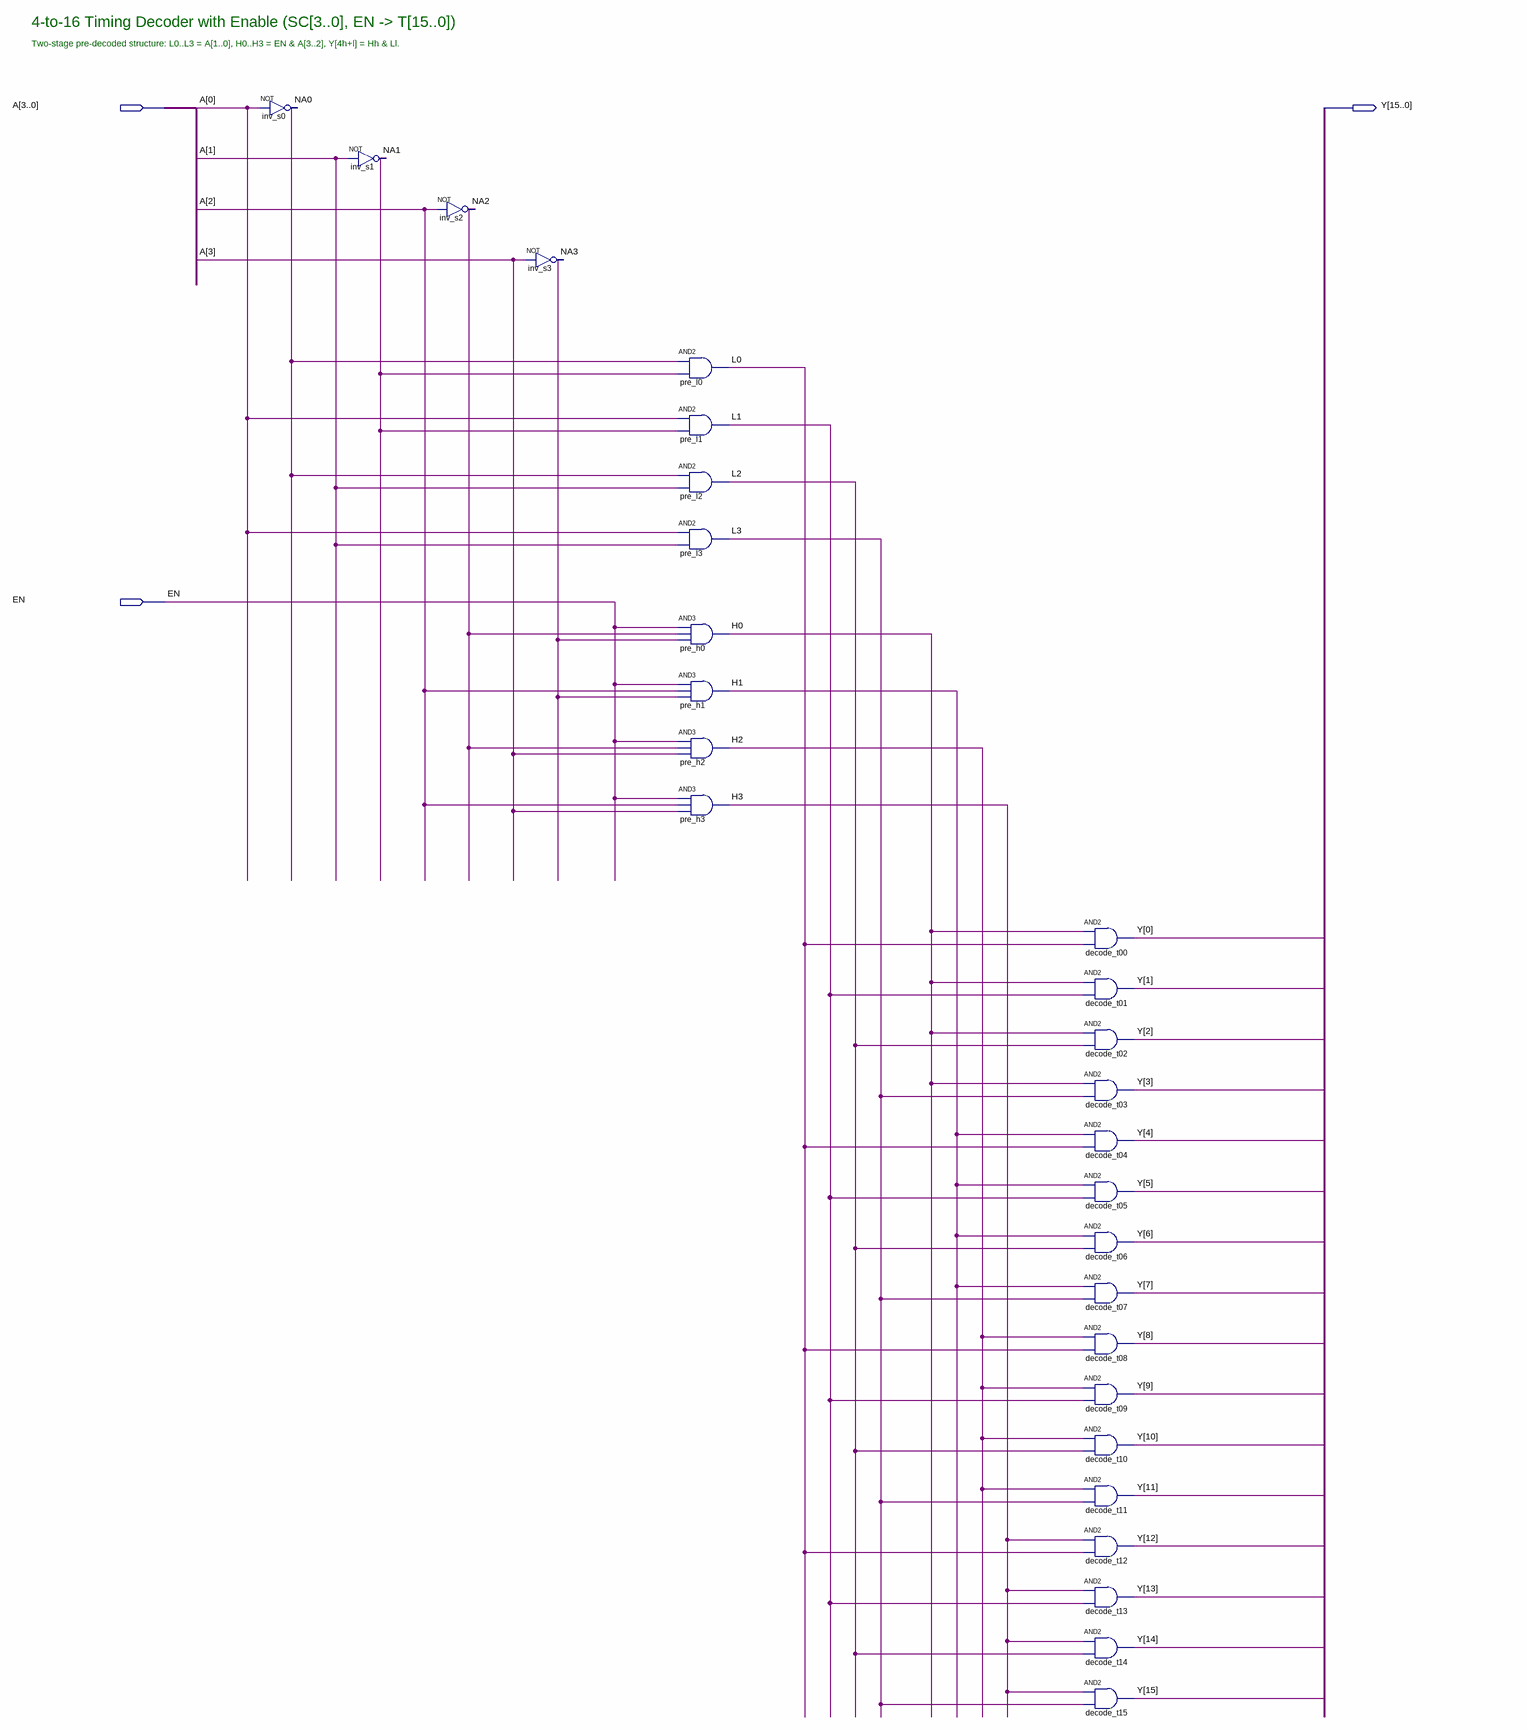
[diagram p0: schematic sheet]
// Quartus schematic dec416_en.bdf as structural Verilog: 28 symbols, 3 pins
module dec416_en (
  input  [3:0] A,
  input  EN,
  output [15:0] Y
);

  wire H0, H1, H2, H3, L0, L1, L2, L3, NA0, NA1, NA2, NA3;

  not inv_s0 (NA0, A[0]);
  not inv_s1 (NA1, A[1]);
  not inv_s2 (NA2, A[2]);
  not inv_s3 (NA3, A[3]);
  and pre_l0 (L0, NA0, NA1);
  and pre_l1 (L1, A[0], NA1);
  and pre_l2 (L2, NA0, A[1]);
  and pre_l3 (L3, A[0], A[1]);
  and pre_h0 (H0, EN, NA2, NA3);
  and pre_h1 (H1, EN, A[2], NA3);
  and pre_h2 (H2, EN, NA2, A[3]);
  and pre_h3 (H3, EN, A[2], A[3]);
  and decode_t00 (Y[0], H0, L0);
  and decode_t01 (Y[1], H0, L1);
  and decode_t02 (Y[2], H0, L2);
  and decode_t03 (Y[3], H0, L3);
  and decode_t04 (Y[4], H1, L0);
  and decode_t05 (Y[5], H1, L1);
  and decode_t06 (Y[6], H1, L2);
  and decode_t07 (Y[7], H1, L3);
  and decode_t08 (Y[8], H2, L0);
  and decode_t09 (Y[9], H2, L1);
  and decode_t10 (Y[10], H2, L2);
  and decode_t11 (Y[11], H2, L3);
  and decode_t12 (Y[12], H3, L0);
  and decode_t13 (Y[13], H3, L1);
  and decode_t14 (Y[14], H3, L2);
  and decode_t15 (Y[15], H3, L3);

  // Notes on the sheet:
  //   4-to-16 Timing Decoder with Enable (SC[3..0], EN -> T[15..0])
  //   Two-stage pre-decoded structure: L0..L3 = A[1..0], H0..H3 = EN & A[3..2], Y[4h+l] = Hh & Ll.
endmodule
